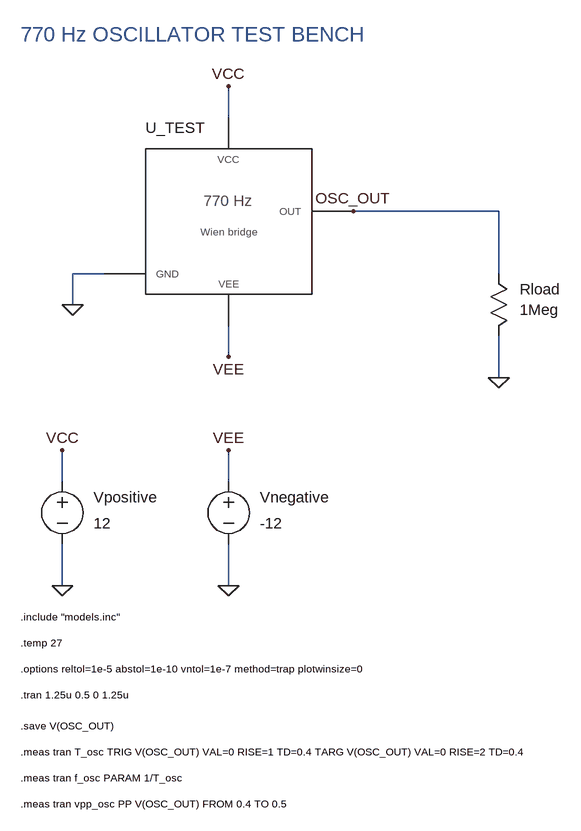
[diagram p0: schematic Test_LowOscillator.asc]
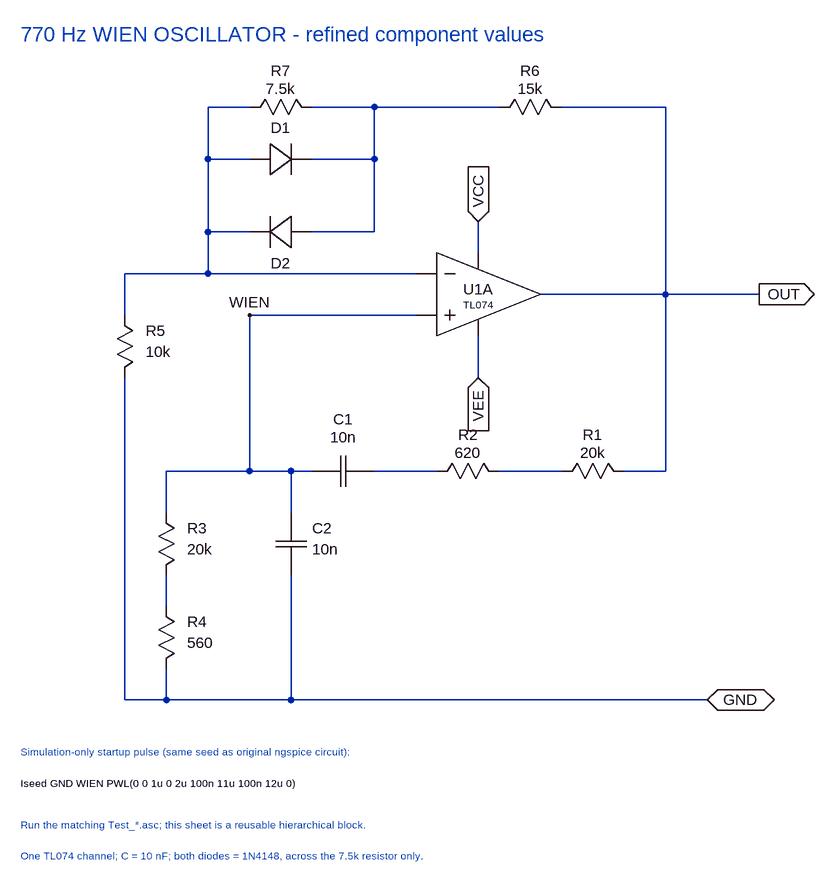
[diagram p1: sub-circuit lowoscillator.asc]
Test_LowOscillator.asc, the LTspice schematic file:
Version 4
SHEET 1 1648 1296
WIRE 384 144 384 96
WIRE 384 464 384 512
WIRE 192 384 144 384
WIRE 144 384 144 432
WIRE 576 288 800 288
WIRE 800 288 800 384
WIRE 800 480 800 544
WIRE 128 704 128 656
WIRE 128 800 128 864
WIRE 384 704 384 656
WIRE 384 800 384 864
FLAG 384 96 VCC
FLAG 384 512 VEE
FLAG 144 432 0
FLAG 576 288 OSC_OUT
FLAG 800 544 0
FLAG 128 656 VCC
FLAG 128 864 0
FLAG 384 656 VEE
FLAG 384 864 0
SYMBOL LowOscillator 256 192 R0
SYMATTR InstName U_TEST
SYMBOL R_V 800 384 R0
SYMATTR InstName Rload
SYMATTR Value 1Meg
SYMBOL V_Source 128 704 R0
SYMATTR InstName Vpositive
SYMATTR Value 12
SYMBOL V_Source 384 704 R0
SYMATTR InstName Vnegative
SYMATTR Value -12
TEXT 64 16 Left 3 ;770 Hz OSCILLATOR TEST BENCH
TEXT 64 912 Left 1 !.include "models.inc"
TEXT 64 952 Left 1 !.temp 27
TEXT 64 992 Left 1 !.options reltol=1e-5 abstol=1e-10 vntol=1e-7 method=trap plotwinsize=0
TEXT 64 1032 Left 1 !.tran 1.25u 0.5 0 1.25u
TEXT 64 1080 Left 1 !.save V(OSC_OUT)
TEXT 64 1120 Left 1 !.meas tran T_osc TRIG V(OSC_OUT) VAL=0 RISE=1 TD=0.4 TARG V(OSC_OUT) VAL=0 RISE=2 TD=0.4
TEXT 64 1160 Left 1 !.meas tran f_osc PARAM 1/T_osc
TEXT 64 1200 Left 1 !.meas tran vpp_osc PP V(OSC_OUT) FROM 0.4 TO 0.5

lowoscillator.asc, the sub-circuit schematic file:
Version 4
SHEET 1 1344 1328
WIRE 864 416 1056 416
WIRE 1056 416 1200 416
WIRE 1056 416 1056 128
WIRE 1056 128 896 128
WIRE 800 128 608 128
WIRE 608 128 512 128
WIRE 416 128 352 128
WIRE 352 128 352 208
WIRE 352 208 352 320
WIRE 352 320 352 384
WIRE 352 384 672 384
WIRE 352 208 416 208
WIRE 512 208 608 208
WIRE 352 320 416 320
WIRE 512 320 608 320
WIRE 608 128 608 208
WIRE 608 208 608 320
WIRE 352 384 224 384
WIRE 224 384 224 448
WIRE 224 544 224 1040
WIRE 1056 416 1056 688
WIRE 1056 688 992 688
WIRE 896 688 800 688
WIRE 704 688 608 688
WIRE 512 688 480 688
WIRE 480 688 416 688
WIRE 416 688 288 688
WIRE 288 688 288 752
WIRE 416 688 416 448
WIRE 416 448 672 448
WIRE 288 848 288 896
WIRE 288 992 288 1040
WIRE 480 688 480 752
WIRE 480 848 480 1040
WIRE 224 1040 288 1040
WIRE 288 1040 480 1040
WIRE 480 1040 1120 1040
WIRE 768 352 768 304
WIRE 768 480 768 544
FLAG 1200 416 OUT
FLAG 416 448 WIEN
FLAG 1120 1040 GND
FLAG 768 304 VCC
FLAG 768 544 VEE
IOPIN 1200 416 Out
IOPIN 1120 1040 BiDir
IOPIN 768 304 In
IOPIN 768 544 In
SYMBOL TL074_Channel 672 352 R0
SYMATTR InstName U1A
SYMBOL R_H 800 128 R0
SYMATTR InstName R6
SYMATTR Value 15k
SYMBOL R_H 416 128 R0
SYMATTR InstName R7
SYMATTR Value 7.5k
SYMBOL Diode_1N4148 416 208 R0
SYMATTR InstName D1
SYMBOL Diode_1N4148 512 320 R180
SYMATTR InstName D2
SYMBOL R_V 224 448 R0
SYMATTR InstName R5
SYMATTR Value 10k
SYMBOL R_H 896 688 R0
SYMATTR InstName R1
SYMATTR Value 20k
SYMBOL R_H 704 688 R0
SYMATTR InstName R2
SYMATTR Value 620
SYMBOL C_H 512 688 R0
SYMATTR InstName C1
SYMATTR Value 10n
SYMBOL R_V 288 752 R0
SYMATTR InstName R3
SYMATTR Value 20k
SYMBOL R_V 288 896 R0
SYMATTR InstName R4
SYMATTR Value 560
SYMBOL C_V 480 752 R0
SYMATTR InstName C2
SYMATTR Value 10n
TEXT 64 16 Left 3 ;770 Hz WIEN OSCILLATOR - refined component values
TEXT 64 1280 Left 1 ;One TL074 channel; C = 10 nF; both diodes = 1N4148, across the 7.5k resistor only.
TEXT 64 1120 Left 1 ;Simulation-only startup pulse (same seed as original ngspice circuit):
TEXT 64 1168 Left 1 !Iseed GND WIEN PWL(0 0 1u 0 2u 100n 11u 100n 12u 0)
TEXT 64 1232 Left 1 ;Run the matching Test_*.asc; this sheet is a reusable hierarchical block.

The netlist it stands for:
* Test_LowOscillator.asc
XU_TEST OSC_OUT VCC VEE 0 lowoscillator
Rload OSC_OUT 0 1Meg
Vpositive VCC 0 12
Vnegative VEE 0 -12

* block symbol definitions
.subckt lowoscillator OUT VCC VEE GND
XU1A WIEN N002 VCC VEE OUT TL074  ; pins IN+ IN- VCC VEE OUT
R6 N001 OUT 15k
R7 N002 N001 7.5k
XD1 N002 N001 1N4148  ; pins A K
XD2 N001 N002 1N4148  ; pins A K
R5 N002 GND 10k
R1 N003 OUT 20k
R2 N004 N003 620
C1 WIEN N004 10n
R3 WIEN N005 20k
R4 N005 GND 560
C2 WIEN GND 10n
* 770 Hz WIEN OSCILLATOR - refined component values
* One TL074 channel; C = 10 nF; both diodes = 1N4148, across the 7.5k resistor only.
* Simulation-only startup pulse (same seed as original ngspice circuit):
Iseed GND WIEN PWL(0 0 1u 0 2u 100n 11u 100n 12u 0)
* Run the matching Test_*.asc; this sheet is a reusable hierarchical block.
.ends lowoscillator

* 770 Hz OSCILLATOR TEST BENCH
.include "models.inc"
.temp 27
.options reltol=1e-5 abstol=1e-10 vntol=1e-7 method=trap plotwinsize=0
.tran 1.25u 0.5 0 1.25u
.save V(OSC_OUT)
.meas tran T_osc TRIG V(OSC_OUT) VAL=0 RISE=1 TD=0.4 TARG V(OSC_OUT) VAL=0 RISE=2 TD=0.4
.meas tran f_osc PARAM 1/T_osc
.meas tran vpp_osc PP V(OSC_OUT) FROM 0.4 TO 0.5
.backanno
.end